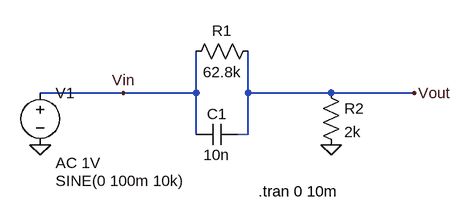
[diagram p0: schematic Filtro_PreEnfase.asc]
Filtro_PreEnfase.asc, the LTspice schematic file:
Version 4.1
SHEET 1 880 680
WIRE -128 160 -256 160
WIRE -16 160 -16 96
WIRE -16 160 -128 160
WIRE 64 160 64 96
WIRE 192 160 64 160
WIRE 320 160 192 160
WIRE -16 224 -16 160
WIRE 64 224 64 160
WIRE 64 224 48 224
FLAG 192 240 0
FLAG -128 160 Vin
FLAG 320 160 Vout
FLAG -256 240 0
SYMBOL res 80 80 R90
WINDOW 0 0 56 VBottom 2
WINDOW 3 32 56 VTop 2
SYMATTR InstName R1
SYMATTR Value 62.8k
SYMBOL cap 48 208 R90
WINDOW 0 0 32 VBottom 2
WINDOW 3 32 32 VTop 2
SYMATTR InstName C1
SYMATTR Value 10n
SYMBOL res 176 144 R0
SYMATTR InstName R2
SYMATTR Value 2k
SYMBOL voltage -256 144 R0
WINDOW 3 24 152 Left 2
WINDOW 123 24 124 Left 2
WINDOW 39 0 0 Left 0
SYMATTR InstName V1
SYMATTR Value SINE(0 100m 10k)
SYMATTR Value2 AC 1V
TEXT 80 312 Left 2 !.tran 0 10m

The netlist it stands for:
* Filtro_PreEnfase.asc
R1 Vout Vin 62.8k
C1 Vout Vin 10n
R2 Vout 0 2k
V1 Vin 0 SINE(0 100m 10k) AC 1V
.tran 0 10m
.backanno
.end